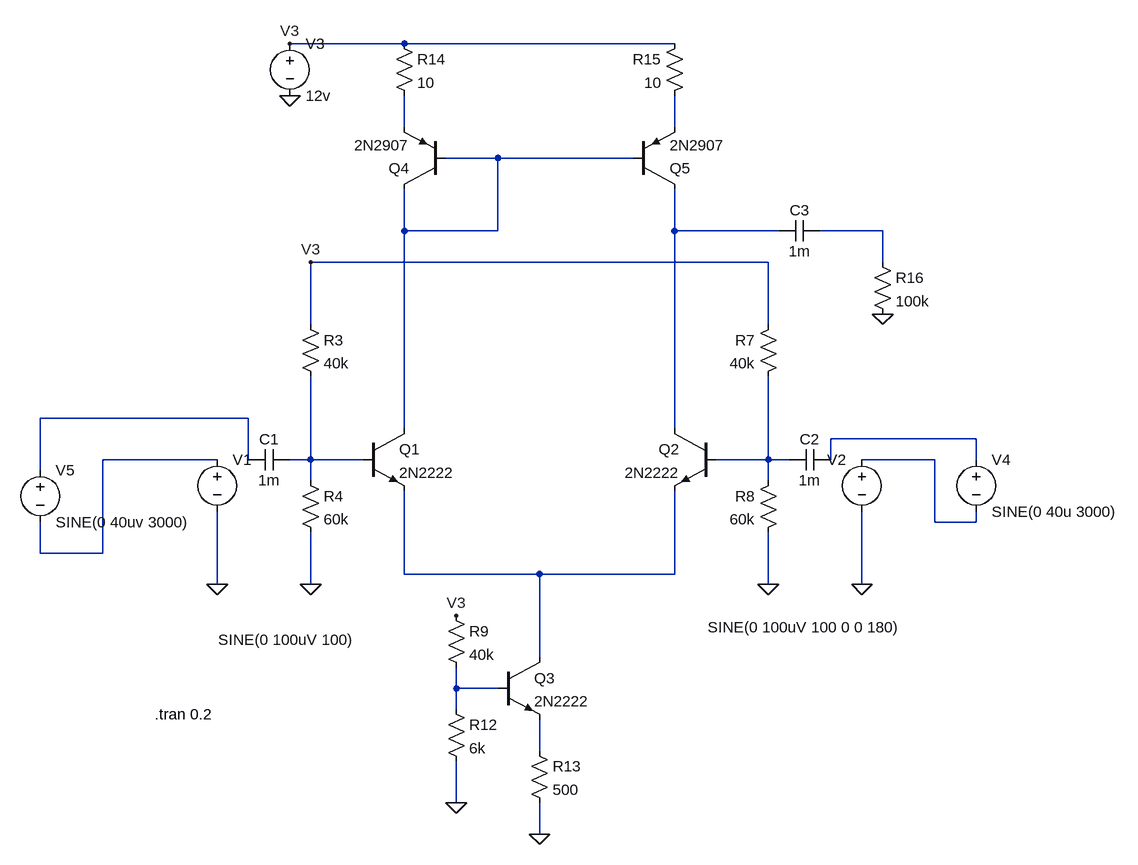
[diagram p0: schematic 06 AD_4_ exemplu anulare zgomot cu_oglinda_de_curent - cu zg.asc]
06 AD_4_ exemplu anulare zgomot cu_oglinda_de_curent - cu zg.asc, the LTspice schematic file:
Version 4
SHEET 1 1236 724
WIRE 96 -512 -80 -512
WIRE 512 -512 96 -512
WIRE 96 -384 96 -432
WIRE 512 -384 512 -432
WIRE 240 -336 160 -336
WIRE 448 -336 240 -336
WIRE 96 -224 96 -288
WIRE 240 -224 240 -336
WIRE 240 -224 96 -224
WIRE 512 -224 512 -288
WIRE 672 -224 512 -224
WIRE 832 -224 736 -224
WIRE 656 -176 -48 -176
WIRE 832 -176 832 -224
WIRE -48 -80 -48 -176
WIRE 656 -80 656 -176
WIRE -144 64 -464 64
WIRE 96 80 96 -224
WIRE 512 80 512 -224
WIRE 976 96 752 96
WIRE -192 128 -368 128
WIRE -144 128 -144 64
WIRE -48 128 -48 0
WIRE -48 128 -80 128
WIRE 32 128 -48 128
WIRE 656 128 656 0
WIRE 656 128 576 128
WIRE 688 128 656 128
WIRE 752 128 752 96
WIRE 912 128 800 128
WIRE 976 128 976 96
WIRE -464 144 -464 64
WIRE -48 160 -48 128
WIRE 656 160 656 128
WIRE 912 224 912 128
WIRE 976 224 976 208
WIRE 976 224 912 224
WIRE -464 272 -464 224
WIRE -368 272 -368 128
WIRE -368 272 -464 272
WIRE 96 304 96 176
WIRE 304 304 96 304
WIRE 512 304 512 176
WIRE 512 304 304 304
WIRE -192 320 -192 208
WIRE -48 320 -48 240
WIRE 656 320 656 240
WIRE 800 320 800 208
WIRE 304 432 304 304
WIRE 176 480 176 448
WIRE 240 480 176 480
WIRE 176 512 176 480
WIRE 304 576 304 528
WIRE 176 656 176 592
WIRE 304 704 304 656
FLAG -48 320 0
FLAG -192 320 0
FLAG 656 320 0
FLAG 800 320 0
FLAG -80 -432 0
FLAG 176 656 0
FLAG 304 704 0
FLAG 832 -96 0
FLAG -80 -512 V3
FLAG 176 368 V3
FLAG -48 -176 V3
SYMBOL npn 32 80 R0
SYMATTR InstName Q1
SYMATTR Value 2N2222
SYMBOL res -64 -96 R0
SYMATTR InstName R3
SYMATTR Value 40k
SYMBOL res -64 144 R0
SYMATTR InstName R4
SYMATTR Value 60k
SYMBOL cap -80 112 R90
WINDOW 0 0 32 VBottom 2
WINDOW 3 32 32 VTop 2
SYMATTR InstName C1
SYMATTR Value 1m
SYMBOL voltage -192 112 R0
WINDOW 123 0 0 Left 2
WINDOW 39 0 0 Left 2
WINDOW 3 2 293 Left 2
SYMATTR Value SINE(0 100uV 100)
SYMATTR InstName V1
SYMBOL npn 576 80 M0
SYMATTR InstName Q2
SYMATTR Value 2N2222
SYMBOL res 672 -96 M0
SYMATTR InstName R7
SYMATTR Value 40k
SYMBOL res 672 144 M0
SYMATTR InstName R8
SYMATTR Value 60k
SYMBOL cap 688 112 M90
WINDOW 0 0 32 VBottom 2
WINDOW 3 32 32 VTop 2
SYMATTR InstName C2
SYMATTR Value 1m
SYMBOL voltage 800 112 M0
WINDOW 123 0 0 Left 2
WINDOW 39 0 0 Left 2
WINDOW 3 -60 274 Left 2
SYMATTR Value SINE(0 100uV 100 0 0 180)
SYMATTR InstName V2
SYMBOL voltage -80 -528 R0
WINDOW 123 0 0 Left 2
WINDOW 39 0 0 Left 2
SYMATTR InstName V3
SYMATTR Value 12v
SYMBOL npn 240 432 R0
SYMATTR InstName Q3
SYMATTR Value 2N2222
SYMBOL res 160 352 R0
SYMATTR InstName R9
SYMATTR Value 40k
SYMBOL res 160 496 R0
SYMATTR InstName R12
SYMATTR Value 6k
SYMBOL res 288 560 R0
SYMATTR InstName R13
SYMATTR Value 500
SYMBOL pnp 160 -288 R180
SYMATTR InstName Q4
SYMATTR Value 2N2907
SYMBOL res 80 -528 R0
SYMATTR InstName R14
SYMATTR Value 10
SYMBOL pnp 448 -288 M180
SYMATTR InstName Q5
SYMATTR Value 2N2907
SYMBOL res 528 -528 M0
SYMATTR InstName R15
SYMATTR Value 10
SYMBOL res 816 -192 R0
SYMATTR InstName R16
SYMATTR Value 100k
SYMBOL cap 736 -240 R90
WINDOW 0 0 32 VBottom 2
WINDOW 3 32 32 VTop 2
SYMATTR InstName C3
SYMATTR Value 1m
SYMBOL voltage 976 112 R0
WINDOW 123 0 0 Left 2
WINDOW 39 0 0 Left 2
SYMATTR InstName V4
SYMATTR Value SINE(0 40u 3000)
SYMBOL voltage -464 128 R0
WINDOW 123 0 0 Left 2
WINDOW 39 0 0 Left 2
SYMATTR InstName V5
SYMATTR Value SINE(0 40uv 3000)
TEXT -288 520 Left 2 !.tran 0.2

The netlist it stands for:
* 06 AD_4_ exemplu anulare zgomot cu_oglinda_de_curent - cu zg.asc
Q1 N003 N009 N012 0 2N2222
R3 V3 N009 40k
R4 N009 0 60k
C1 N009 N006 1m
V1 N008 0 SINE(0 100uV 100)
Q2 N004 N010 N012 0 2N2222
R7 V3 N010 40k
R8 N010 0 60k
C2 N010 N007 1m
V2 N011 0 SINE(0 100uV 100 0 0 180)
V3 V3 0 12v
Q3 N012 N013 N014 0 2N2222
R9 V3 N013 40k
R12 N013 0 6k
R13 N014 0 500
Q4 N003 N003 N001 0 2N2907
R14 V3 N001 10
Q5 N004 N003 N002 0 2N2907
R15 V3 N002 10
R16 N005 0 100k
C3 N005 N004 1m
V4 N007 N011 SINE(0 40u 3000)
V5 N006 N008 SINE(0 40uv 3000)
.model NPN NPN
.model PNP PNP
.lib standard.bjt
.tran 0.2
.backanno
.end